# Altium project PCB_TEAM07_TH.PrjPcb
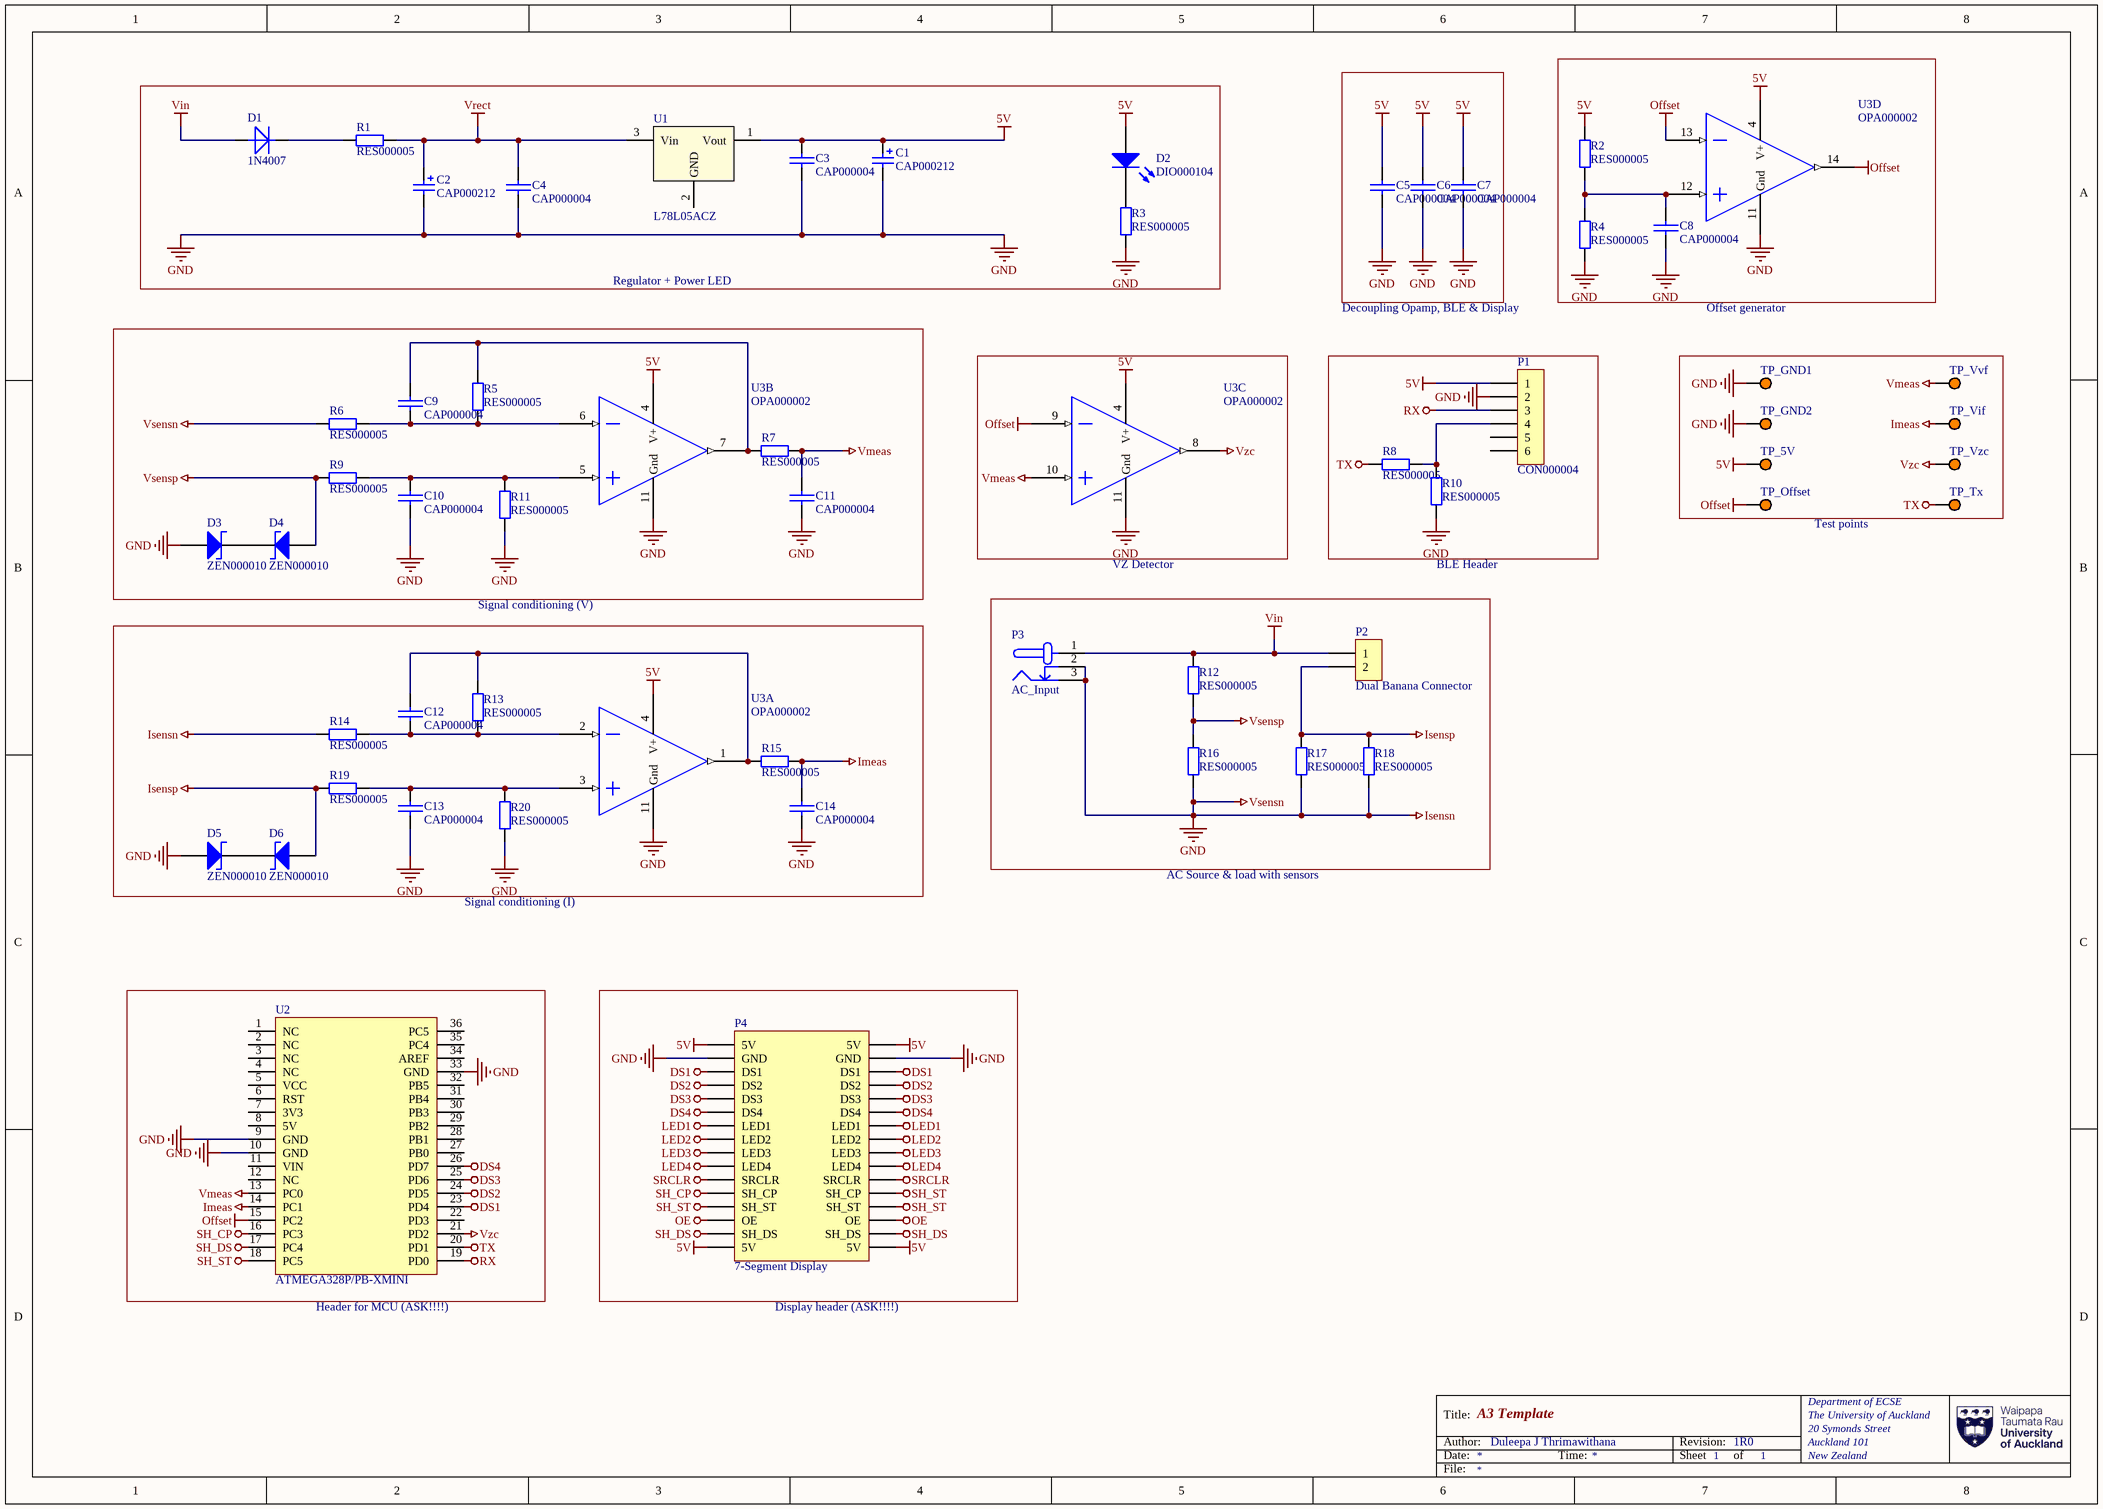
[diagram p0: PCB_TEAM07_TH_Sch.SchDoc]
1 sheet, 55 parts. Net scope: global (net labels, ports and power ports of the same name join across sheets).
Board file: PCB_TEAM07_TH_PCB.PcbDoc

## Sheet PCB_TEAM07_TH_Sch.SchDoc: A3 Template
size A3; Author: Duleepa J Thrimawithana; CompanyName: The University of Auckland; Organization: Department of ECSE; Address1: 20 Symonds Street; Address2: Auckland 101; Address3: New Zealand; Revision: 1R0; SheetNumber: 1; SheetTotal: 1

### Parts
C1  CAP000212  [ECE-CAPPR2-5X11TH]
C2  CAP000212  [ECE-CAPPR2-5X11TH]
C3  CAP000004  [ECE-CAPR0.2x0.1TH]
C4  CAP000004  [ECE-CAPR0.2x0.1TH]
C5  CAP000004  [ECE-CAPR0.2x0.1TH]
C6  CAP000004  [ECE-CAPR0.2x0.1TH]
C7  CAP000004  [ECE-CAPR0.2x0.1TH]
C8  CAP000004  [ECE-CAPR0.2x0.1TH]
C9  CAP000004  [ECE-CAPR0.2x0.1TH]
C10  CAP000004  [ECE-CAPR0.2x0.1TH]
C11  CAP000004  [ECE-CAPR0.2x0.1TH]
C12  CAP000004  [ECE-CAPR0.2x0.1TH]
C13  CAP000004  [ECE-CAPR0.2x0.1TH]
C14  CAP000004  [ECE-CAPR0.2x0.1TH]
D1  1N4007  [D-AXIAL0.4]
D2  DIO000104  [ECE-LED2012-0805SM]
D3  ZEN000010  [ECE-DIOAD2TH1.00]
D4  ZEN000010  [ECE-DIOAD2TH1.00]
D5  ZEN000010  [ECE-DIOAD2TH1.00]
D6  ZEN000010  [ECE-DIOAD2TH1.00]
P1  CON000004  [ECE-600106STTH]
P2  Dual Banana Connector  [Dual Banana Connector-Footprint-1]
P3  AC_Input  [Barrel Jack-Footprint-1]
P4  7-Segment Display  [7-Segment Display-Footprint-1]
R1  RES000005  [ECE-RESA0.4TH]
R2  RES000005  [ECE-RESA0.4TH]
R3  RES000005  [ECE-RESA0.4TH]
R4  RES000005  [ECE-RESA0.4TH]
R5  RES000005  [ECE-RESA0.4TH]
R6  RES000005  [ECE-RESA0.4TH]
R7  RES000005  [ECE-RESA0.4TH]
R8  RES000005  [ECE-RESA0.4TH]
R9  RES000005  [ECE-RESA0.4TH]
R10  RES000005  [ECE-RESA0.4TH]
R11  RES000005  [ECE-RESA0.4TH]
R12  RES000005  [ECE-RESA0.4TH]
R13  RES000005  [ECE-RESA0.4TH]
R14  RES000005  [ECE-RESA0.4TH]
R15  RES000005  [ECE-RESA0.4TH]
R16  RES000005  [ECE-RESA0.4TH]
R17  RES000005  [ECE-RESA0.4TH]
R18  RES000005  [ECE-RESA0.4TH]
R19  RES000005  [ECE-RESA0.4TH]
R20  RES000005  [ECE-RESA0.4TH]
TP_5V  (no value)  [Test-Pin-TH]
TP_GND1  (no value)  [Test-Pin-TH]
TP_GND2  (no value)  [Test-Pin-TH]
TP_Offset  (no value)  [Test-Pin-TH]
TP_Tx  (no value)  [Test-Pin-TH]
TP_Vif  (no value)  [Test-Pin-TH]
TP_Vvf  (no value)  [Test-Pin-TH]
TP_Vzc  (no value)  [Test-Pin-TH]
U1  L78L05ACZ  [TO-92]
U2  ATMEGA328P/PB-XMINI  [FP-ATMEGA328P-XMINI-MFG]
U3  OPA000002  [ECE-DIP14TH]  (parts A,B,C,D of 4)

### Blocks framed on the sheet
Regulator + Power LED: C1-C4 D1 D2 R1 R3 U1
Signal conditioning (V): C12-C14 D5 D6 R13-R15 R19 R20 U3

### Nets
5V: C1.1 C3.1 C5.1 C6.1 C7.1 D2.1(A) P1.1 P4.1(5V) P4.2(5V) P4.31(5V) P4.32(5V) R2.2 TP_5V.1 U1.1(Vout) U3.4(V+)
DS1: P4.5(DS1) P4.6(DS1) U2.23(PD4)
DS2: P4.7(DS2) P4.8(DS2) U2.24(PD5)
DS3: P4.9(DS3) P4.10(DS3) U2.25(PD6)
DS4: P4.11(DS4) P4.12(DS4) U2.26(PD7)
GND: C1.2 C2.2 C3.2 C4.2 C5.2 C6.2 C7.2 C8.2 C10.2 C11.2 C13.2 C14.2 D3.1(A) D5.1(A) P1.2 P3.2(GND_ALT) P3.3(GND) P4.3(GND) P4.4(GND) R3.1 R4.1 R6.1 R10.1 R11.1 R14.1 R16.1 R17.1 R18.1 R20.1 TP_GND1.1 TP_GND2.1 U2.9(GND) U2.10(GND) U2.33(GND) U3.11(Gnd)  [also labelled Isensn, Vsensn]
Imeas: C14.1 R15.1 TP_Vif.1 U2.14(PC1)
Isensp: D6.1(A) P2.2 R17.2 R18.2 R19.1
LED1: P4.13(LED1) P4.14(LED1)
LED2: P4.15(LED2) P4.16(LED2)
LED3: P4.17(LED3) P4.18(LED3)
LED4: P4.19(LED4) P4.20(LED4)
OE: P4.27(OE) P4.28(OE)
Offset: TP_Offset.1 U2.15(PC2) U3.9(IN3(-)) U3.13(IN4(-)) U3.14(OUT4)
RX: P1.3 U2.19(PD0)
SH_CP: P4.23(SH_CP) U2.16(PC3)
SH_DS: P4.29(SH_DS) P4.30(SH_DS) U2.17(PC4)
SH_ST: P4.24(SH_CP) P4.25(SH_ST) P4.26(SH_ST) U2.18(PC5)
SRCLR: P4.21(SRCLR) P4.22(SRCLR)
TX: R8.2 TP_Tx.1 U2.20(PD1)
Vin: D1.2(A) P2.1 P3.1(VCC) R12.2
Vmeas: C11.1 R7.1 TP_Vvf.1 U2.13(PC0) U3.10(IN3(+))
Vrect: C2.1 C4.1 R1.2 U1.3(Vin)
Vsensp: D4.1(A) R9.1 R12.1 R16.2
Vzc: TP_Vzc.1 U2.21(PD2) U3.8(OUT3)
NetC8_1: C8.1 R2.1 R4.2 U3.12(IN4(+))
NetC9_1: C9.1 R5.2 R7.2 U3.7(OUT2)
NetC9_2: C9.2 R5.1 R6.2 U3.6(IN2(-))
NetC10_1: C10.1 R9.2 R11.2 U3.5(IN2+))
NetC12_1: C12.1 R13.2 R15.2 U3.1(OUT1)
NetC12_2: C12.2 R13.1 R14.2 U3.2(IN1(-))
NetC13_1: C13.1 R19.2 R20.2 U3.3(IN1(+))
NetD1_1: D1.1(K) R1.1
NetD2_2: D2.2(K) R3.2
NetD3_2: D3.2(K) D4.2(K)
NetD5_2: D5.2(K) D6.2(K)
NetP1_4: P1.4 R8.1 R10.2

Not connected (* = marked no-connect by the designer): P1 5 6; U1 2(GND); U2 1(NC) 2(NC) 3(NC) 4(NC) 5(VCC) 6(RST) 7(3V3) 8(5V) 11(VIN) 12(NC) 22(PD3) 27(PB0) 28(PB1) 29(PB2) 30(PB3) 31(PB4) 32(PB5) 34(AREF) 35(PC4) 36(PC5)

### Notes on the sheet
- Decoupling Opamp, BLE & Display
- Offset generator
- VZ Detector
- BLE Header
- Test points
- Signal conditioning (I)
- AC Source & load with sensors
- (near U2) Header for MCU (ASK!!!!)
- Display header (ASK!!!!)
- Title:
- Author:
- Date:
- Time:
- Revision:
- Sheet
- of
- File:

### Library data of the parts
C1 C2 = CMP-039-000101-1: CAP ELEC 22uF 25V TH; Manufacturer-PN: UVZ1E220MDD; Manufactuer: Nichicon; Path: ece/ts/Lists/Stock Inventory; Assembly Method: Through hole; Item Type: Item; Category: Capacitor; Value: 22uF; Datasheet Link: http://share.engineering.auckland.ac.nz/ece/ts/Student%20Documents/CAP-UVZ1E100MDD.pdf; UoA Stock#: CAP000212; Size/Package: 5X11; Supplier1: Electus; Voltage/Current: 25V; Component Type: NA; Supplier1-PN: RE6090; Review-date: 41979; Status: Active
C3-C14 = CMP-039-000003-1: CAP CER 18pF 50V TH; Item Type: Item; Assembly Method: Through hole; Path: ece/ts/Lists/Stock Inventory; Datasheet Link: http://share.engineering.auckland.ac.nz/ece/ts/Student%20Documents/CER%20CAP.pdf; Voltage/Current: 50V; Size/Package: Radial; UoA Stock#: CAP000004; Component Type: NA; Value: 18pF; Category: Capacitor; Status: Obsolete
D1 = CMP-00015-1: Standard Rectifier Diode Switching 1KV 1A Axial 0.4; Forward Voltage: 1.1V; Current Rating: 1A
D2 = CMP-043-000010-1: LED GREEN CLEAR 0805 SM; Manufactuer: Lite-On Inc; Path: ece/ts/Lists/Stock Inventory; Item Type: Item; Voltage/Current: 20mA; Assembly Method: Surface Mount; Value: LTST-C170KGKT; Supplier1-PN: 160-1414-6-ND; Size/Package: 0805 (2012 Metric); Status: Active; Category: Diode; UoA Stock#: DIO000104; Component Type: LED-0805-GREEN; Supplier1: Digikey; Datasheet Link: http://share.engineering.auckland.ac.nz/ece/ts/Student%20Documents/LED-S_110_LTST-C170KGKT.pdf; Manufacturer-PN: LTST-C170KGKT
D3-D6 = CMP-055-000009-1: 8.2V Zener Diodes TH; Manufactuer: NXP; Manufacturer-PN: BZX79-C8V2; Path: ece/ts/Lists/Stock Inventory; Assembly Method: Through hole; Item Type: Item; Value: BZX79-C8V2; Status: Active; Category: Zener; Supplier1-PN: 1097242; Supplier1: Element14; Voltage/Current: 8.2V; UoA Stock#: ZEN000010
P1 = CMP-040-000003-1: HEADER POLARISED 6WAY TH; Manufactuer: GTK; Manufacturer-PN: 600106ST; Path: ece/ts/Lists/Stock Inventory; Assembly Method: Through hole; Item Type: Item; Category: Connector; Value: 6 Way; Supplier1-PN: YY3N06; Size/Package: 2.54 Radial; Status: Active; Datasheet Link: http://share.engineering.auckland.ac.nz/ece/ts/Student%20Documents/polarised_connectors.pdf; Supplier2-PN: 600106ST; Component Type: NA; UoA Stock#: CON000004; Supplier1: Elecon; Supplier2: Active Components
P2 = CMP-00017-1: Dual Banan connector
P3 = CMP-002-00000-1: Barrel jack
P4 = CMP-00020-1: 7-Segment display for EC209
R1-R20 = CMP-052-000004-1: RES MF 2R2 TH; Path: ece/ts/Lists/Stock Inventory; Assembly Method: Through hole; Voltage/Current: 0.6W; Value: 2.2; Item Type: Item; UoA Stock#: RES000005; Status: Active; Size/Package: Axial 10mm; Component Type: NA; Supplier1-PN: T462168; Category: Resistor; Supplier1: Active components
TP_5V TP_GND1 TP_GND2 TP_Offset TP_Tx TP_Vif TP_Vvf TP_Vzc = CMP-00024-1: Test pin TH generic
U1 = CMP-00021-1: Pwr Sply Func, Voltage Regulator, Positive Voltage Out, TO-92, Is 5.5MA, Vo 5V, VI 10V; Max Supply Voltage: 20V; Max Output current: 100mA; Output Voltage Accuracy: 4%; Quiescent Current: 6mA; Power Supply Rejection Ratio (PSRR): 49dB; Case/Package: TO-92; Output Voltage: 5V
U2 = CMP-00018-1: Evaluation Board, ATMEGA328P/PB MCU, On-Board Debugger, Auto-ID Identification; Number of I/Os: 22; Number of Bits: 8; Max Supply Voltage: 5V
U3 = CMP-049-000001-1: IC OPAMP LM324 QUAD TH; Manufacturer-PN: LM324N; Manufactuer: Texas instruments; Path: ece/ts/Lists/Stock Inventory; Item Type: Item; Value: LM324N; Assembly Method: Through hole; UoA Stock#: OPA000002; Supplier2-PN: LM324N; Category: OpAmp; Supplier2: Active Components; Supplier1: Digikey; Supplier1-PN: 296-1391-5-ND; Datasheet Link: http://share.engineering.auckland.ac.nz/ece/ts/Student%20Documents/LM324.pdf; Status: Active; Size/Package: DIP14